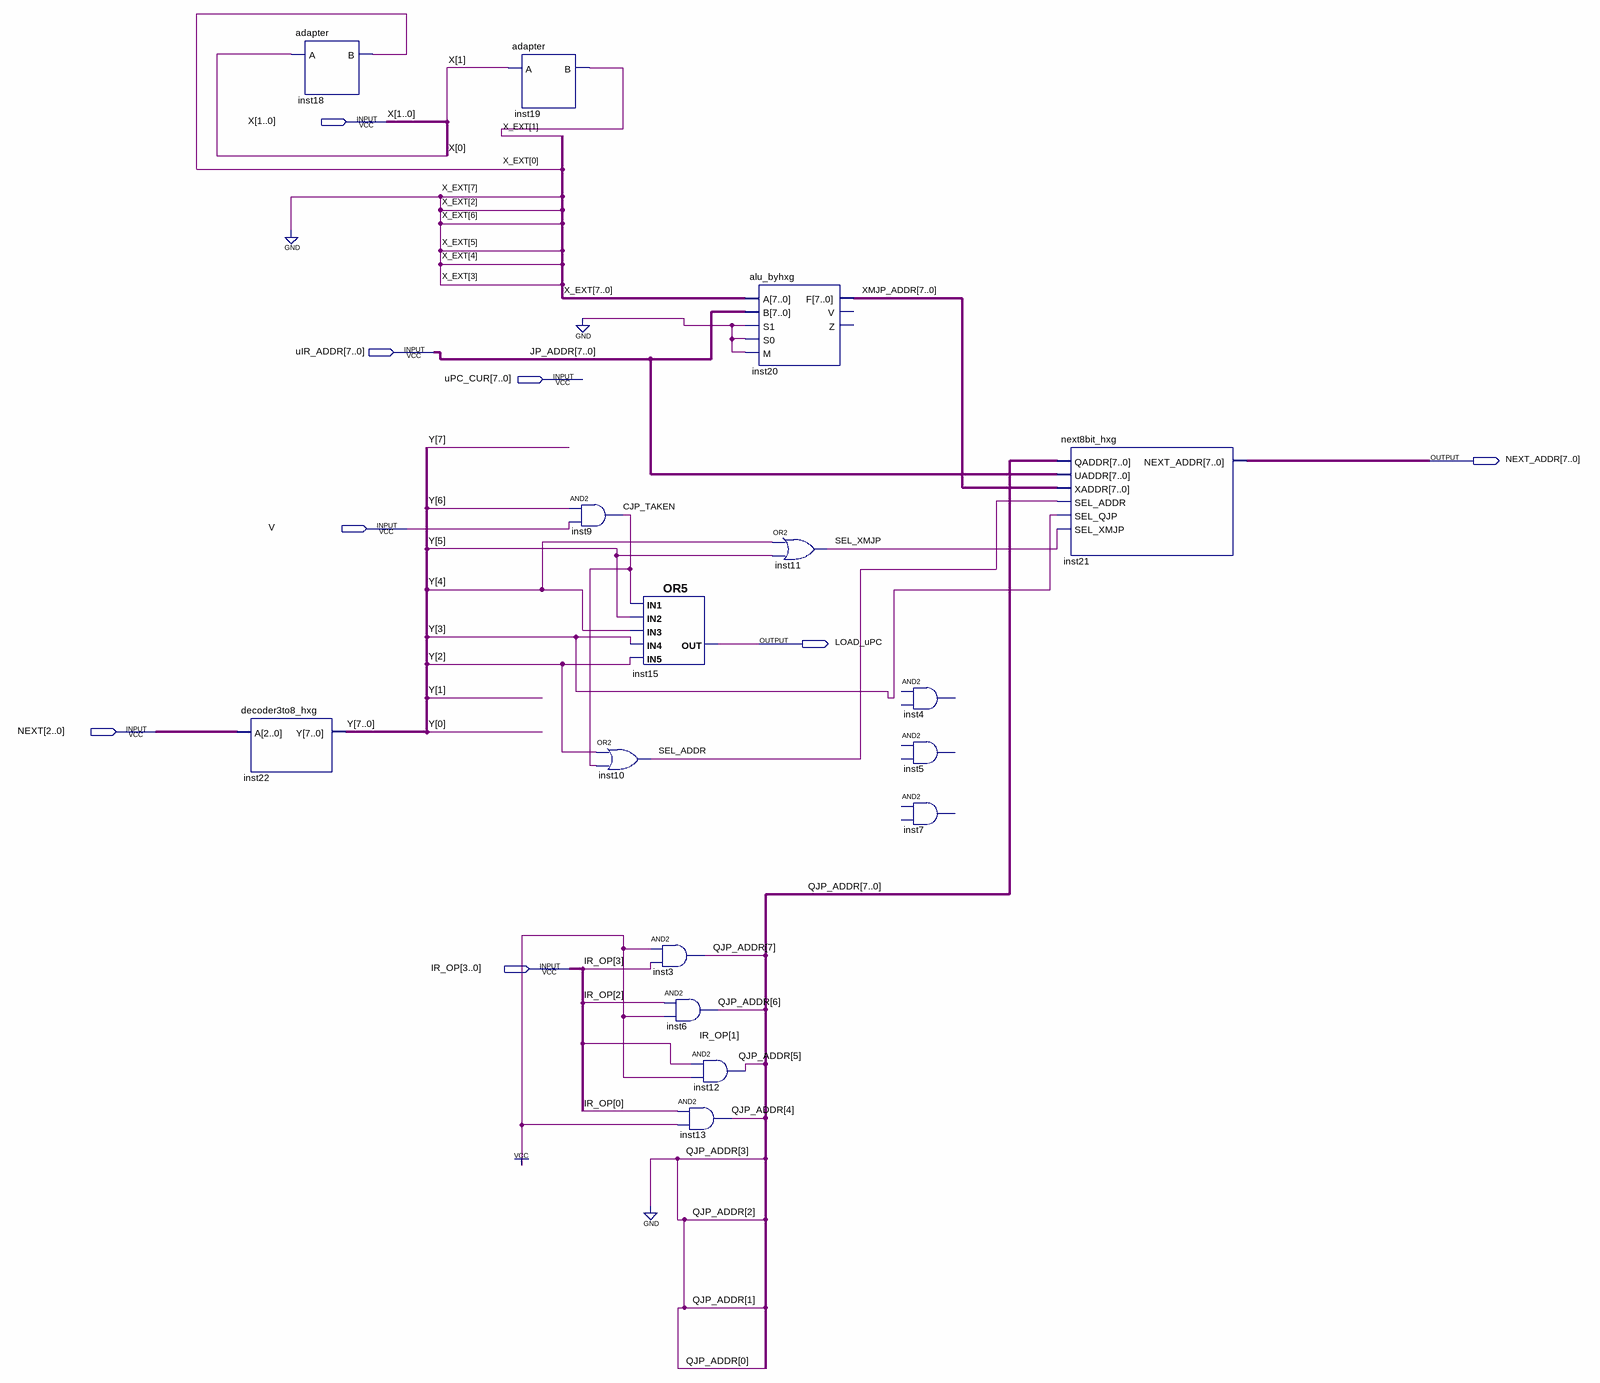
[diagram p0: schematic sheet]
// Quartus schematic micro_ad_from_cop_hxgdly.bdf as structural Verilog: 16 symbols, 8 pins
module micro_ad_from_cop_hxgdly (
  input  [1:0] X,
  input  [7:0] uIR_ADDR,
  input  [7:0] uPC_CUR,
  input  V,
  input  [2:0] NEXT,
  input  [3:0] IR_OP,
  output [7:0] NEXT_ADDR,
  output LOAD_uPC
);

  wire CJP_TAKEN, SEL_ADDR, SEL_XMJP;
  wire [1:0] X_EXT;
  wire [7:0] XMJP_ADDR, Y;
  wire [7:4] QJP_ADDR;

  decoder3to8_hxg inst22 (.A(NEXT), .Y(Y));
  adapter inst18 (.A(X[0]), .B(X_EXT[0]));
  adapter inst19 (.A(X[1]), .B(X_EXT[1]));
  and inst9 (CJP_TAKEN, Y[6], V);
  or inst10 (SEL_ADDR, Y[2], CJP_TAKEN);
  or inst15 (LOAD_uPC, CJP_TAKEN, Y[5], Y[4], Y[3], Y[2]);
  and inst3 (QJP_ADDR[7], 1'b1, IR_OP[3]);
  and inst6 (QJP_ADDR[6], IR_OP[2], 1'b1);
  and inst12 (QJP_ADDR[5], IR_OP[1], 1'b1);
  and inst13 (QJP_ADDR[4], IR_OP[0], 1'b1);
  alu_byhxg inst20 (.A({{6{1'b0}}, X_EXT}), .B(uIR_ADDR), .S1(1'b0), .S0(1'b0), .M(1'b0), .F(XMJP_ADDR));  // open: V, Z
  or inst11 (SEL_XMJP, Y[4], Y[5]);
  // AND2 inst4 is placed but not wired
  // AND2 inst5 is placed but not wired
  // AND2 inst7 is placed but not wired
  next8bit_hxg inst21 (
    .QADDR({QJP_ADDR, 4'b0000}), .UADDR(uIR_ADDR), .XADDR(XMJP_ADDR), .SEL_ADDR(SEL_ADDR), .SEL_QJP(Y[3]),
    .SEL_XMJP(SEL_XMJP), .NEXT_ADDR(NEXT_ADDR));

  // Other names for the same wires on the sheet: JP_ADDR[7:0] = uIR_ADDR
endmodule
